# Altium project DC-UPS-v1.0.PrjPcb (part 6 of 8)

## Sheet Buck-Boost-Sheet.SchDoc
size A4; SheetNumber: 4; SheetTotal: 6
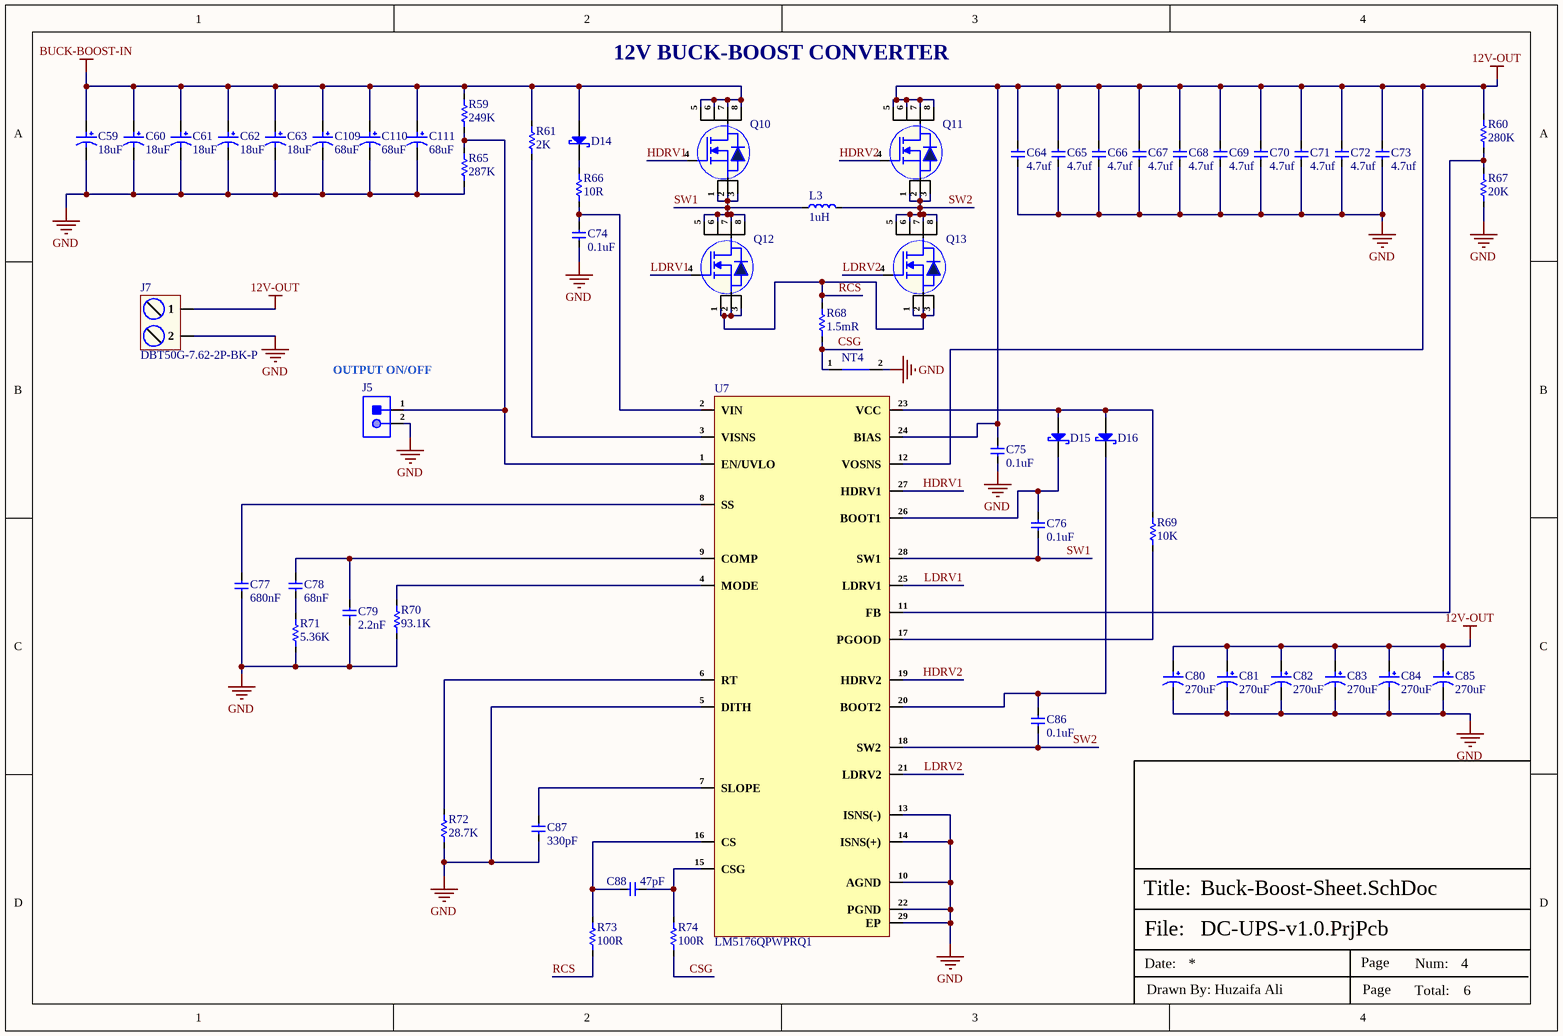
[diagram p3: Buck-Boost-Sheet.SchDoc]

### Parts
C59  18uF  [50SVPF18M]
C60  18uF  [50SVPF18M]
C61  18uF  [50SVPF18M]
C62  18uF  [50SVPF18M]
C63  18uF  [50SVPF18M]
C64  4.7uf  [Cap-0805]
C65  4.7uf  [Cap-0805]
C66  4.7uf  [Cap-0805]
C67  4.7uf  [Cap-0805]
C68  4.7uf  [Cap-0805]
C69  4.7uf  [Cap-0805]
C70  4.7uf  [Cap-0805]
C71  4.7uf  [Cap-0805]
C72  4.7uf  [Cap-0805]
C73  4.7uf  [Cap-0805]
C74  0.1uF  [CAP-0603]
C75  0.1uF  [CAP-0603]
C76  0.1uF  [CAP-0603]
C77  680nF  [Cap-1206]
C78  68nF  [Cap-0603]
C79  2.2nF  [Cap-0603]
C80  270uF  [16SVPG270M]
C81  270uF  [16SVPG270M]
C82  270uF  [16SVPG270M]
C83  270uF  [16SVPG270M]
C84  270uF  [16SVPG270M]
C85  270uF  [16SVPG270M]
C86  0.1uF  [CAP-0603]
C87  330pF  [Cap-0603]
C88  47pF  [Cap-0603]
C109  68uF  [50SVPF68M]
C110  68uF  [50SVPF68M]
C111  68uF  [50SVPF68M]
D14  CDBUR0230L-HF  [SOD-523F]  (value not drawn)
D15  CDBUR0230L-HF  [SOD-523F]  (value not drawn)
D16  B0520W  [SOD-123F]  (value not drawn)
J5  B2B-XH-A(LF)(SN)  [B2B-XH-A(LF)(SN)_]  (value not drawn)
J7  DBT50G-7.62-2P-BK-P  [DBT50G-7.62-2P-BK-P]
L3  1uH  [FXL2213-1R0-M]
NT4  Net Tie_SMD  [Net Tie Pad]  (value not drawn)  (net tie, no BOM)
Q10  CSD18511Q5A  [8-VSONP (5x6)]  (value not drawn)
Q11  CSD19533Q5A  [8-VSONP (5x6)]  (value not drawn)
Q12  CSD18531Q5A  [8-VSONP (5x6)]  (value not drawn)
Q13  CSD19533Q5A  [8-VSONP (5x6)]  (value not drawn)
R59  249K  [Res-0402]
R60  280K  [Res-0603]
R61  2K  [Res-0402]
R65  287K  [Res-0402]
R66  10R  [Res-0603]
R67  20K  [Res-0603]
R68  1.5mR  [5931]
R69  10K  [Res-0603]
R70  93.1K  [Res-0603]
R71  5.36K  [Res-0603]
R72  28.7K  [Res-0201]
R73  100R  [Res-0603]
R74  100R  [Res-0603]
U7  LM5176QPWPRQ1  [HTSSOP-28-EP]

### Nets
12V-OUT: C64.2 C65.2 C66.2 C67.2 C68.2 C69.2 C70.2 C71.2 C72.2 C73.2 C75.2 C80.1 C81.1 C82.1 C83.1 C84.1 C85.1 J7.1 Q11.5(D) Q11.6(D) Q11.7(D) Q11.8(D) R60.2 U7.12(VOSNS) U7.24(BIAS)
BUCK-BOOST-IN: C59.1 C60.1 C61.1 C62.1 C63.1 C109.1 C110.1 C111.1 D14.1(A) Q10.5(D) Q10.6(D) Q10.7(D) Q10.8(D) R59.2 R61.2
GND: C59.2 C60.2 C61.2 C62.2 C63.2 C64.1 C65.1 C66.1 C67.1 C68.1 C69.1 C70.1 C71.1 C72.1 C73.1 C74.1 C75.1 C77.1 C79.1 C80.2 C81.2 C82.2 C83.2 C84.2 C85.2 C87.1 C109.2 C110.2 C111.2 J5.2 J7.2 NT4.2 R65.1 R67.1 R70.1 R71.1 R72.1 U7.5(DITH) U7.10(AGND) U7.13(ISNS(-)) U7.14(ISNS(+)) U7.22(PGND) U7.29(EP)
CSG: NT4.1 R68.1 R74.1
HDRV1: Q10.4(G) U7.27(HDRV1)
HDRV2: Q11.4(G) U7.19(HDRV2)
LDRV1: Q12.4(G) U7.25(LDRV1)
LDRV2: Q13.4(G) U7.21(LDRV2)
RCS: Q12.1(S) Q12.2(S) Q12.3(S) Q13.1(S) Q13.2(S) Q13.3(S) R68.2 R73.1
SW1: C76.1 L3.1 Q10.1(S) Q10.2(S) Q10.3(S) Q12.5(D) Q12.6(D) Q12.7(D) Q12.8(D) U7.28(SW1)
SW2: C86.1 L3.2 Q11.1(S) Q11.2(S) Q11.3(S) Q13.5(D) Q13.6(D) Q13.7(D) Q13.8(D) U7.18(SW2)
NetC74_2: C74.2 R66.1 U7.2(VIN)
NetC76_2: C76.2 D15.2(K) U7.26(BOOT1)
NetC77_2: C77.2 U7.8(SS)
NetC78_1: C78.1 R71.2
NetC78_2: C78.2 C79.2 U7.9(COMP)
NetC86_2: C86.2 D16.1(K) U7.20(BOOT2)
NetC87_2: C87.2 U7.7(SLOPE)
NetC88_1: C88.1 R73.2 U7.16(CS)
NetC88_2: C88.2 R74.2 U7.15(CSG)
NetD14_2: D14.2(K) R66.2
NetD15_1: D15.1(A) D16.2(A) R69.2 U7.23(VCC)
NetJ5_1: J5.1 R59.1 R65.2 U7.1(EN/UVLO)
NetR60_1: R60.1 R67.2 U7.11(FB)
NetR61_1: R61.1 U7.3(VISNS)
NetR69_1: R69.1 U7.17(PGOOD)
NetR70_2: R70.2 U7.4(MODE)
NetR72_2: R72.2 U7.6(RT)

### Notes on the sheet
- 12V BUCK-BOOST CONVERTER
- (near J5) OUTPUT ON/OFF
- File:
- Title:
- Date:
- Page
- Num:
- Total:
- Drawn By: Huzaifa Ali

### Library data of the parts
C59-C63 = 50SVPF18M: CAP ALUM POLY 18UF 20% 50V SMD; Manufacturer: Panasonic; Item Type: Capacitors; Supplier: Mouser; LCSC Part Number: C178374; Manufacturer Part Number: 50SVPF18M; RoHS: Yes; Stock: 2258; Pricing: 1=1.44, 10=0.995, 50=0.995, 100=0.799, 1000=0.562, 10000=0.498 (USD); ComponentLink1URL: https://datasheet.ciiva.com/24033/svpf-os-262415-24033818.pdf?src-supplier=Mouser; ComponentLink1Description: https://datasheet.ciiva.com/24033/svpf-os-262415-24033818.pdf?src-supplier=Mouser; ComponentLink2URL: https://datasheet.ciiva.com/25761/1734360-25761272.pdf?src-supplier=Farnell; ComponentLink2Description: https://datasheet.ciiva.com/25761/1734360-25761272.pdf?src-supplier=Farnell; ComponentLink3URL: https://datasheet.ciiva.com/48542/svpf-eng-ds-48542431.pdf?src-supplier=Distrelec; ComponentLink3Description: https://datasheet.ciiva.com/48542/svpf-eng-ds-48542431.pdf?src-supplier=Distrelec; ComponentLink4URL: https://datasheet.ciiva.com/22746/1734360-22746277.pdf?src-supplier=Element14; ComponentLink4Description: https://datasheet.ciiva.com/22746/1734360-22746277.pdf?src-supplier=Element14
C64-C73 = GRM21BR61H475KE51L: CAP CER 4.7UF 50V X5R 0805; Manufacturer: Murata; Material: Ceramic; Tolerance: 10%; Item Type: Capacitor; Supplier 1: Rs; Manufacturer Part Number: GRM21BR61H475KE51L; RoHS: Yes; Category: Ceramic Capacitors; Stock 1: 37300; Pricing 1: 500=0.09400, 1000=0.08800, 2000=0.08300, 5000=0.07500 (GBP); Mount: Surface Mount; Case/Package: 0805; Case Code (Metric): 2012; Case Code (Imperial): 0805; Min Operating Temperature: -55°C; Max Operating Temperature: 85°C; Capacitance: 4.7uF; Packaging: Tape and Reel; Dielectric: X5R; Voltage Rating: 50V; Voltage Rating (DC): 50V; Series: GRM; Length: 2mm; Width: 0.049inch; Height: 1.25mm; Thickness: 0.055inch; Depth: 1.25mm; Reach SVHC Compliant: Yes; Lead Free: Lead Free; RoHS Compliant: Yes; ComponentLink1URL: http://www.farnell.com/datasheets/2079186.pdf?src-supplier=Farnell; ComponentLink1Description: http://www.farnell.com/datasheets/2079186.pdf?src-supplier=Farnell; ComponentLink2URL: http://components.arrow.com/part/dataview/61084395S454511N2606?src-supplier=Arrow+Electronics; ComponentLink2Description: http://components.arrow.com/part/dataview/61084395S454511N2606?src-supplier=Arrow+Electronics; ComponentLink3URL: http://www.farnell.com/datasheets/2079186.pdf?src-supplier=Element14; ComponentLink3Description: http://www.farnell.com/datasheets/2079186.pdf?src-supplier=Element14; ComponentLink4URL: http://search.murata.co.jp/Ceramy/image/img/A01X/G101/ENG/GRM21BR61H475KE51-01.pdf?src-supplier=Digi-Key; ComponentLink4Description: http://search.murata.co.jp/Ceramy/image/img/A01X/G101/ENG/GRM21BR61H475KE51-01.pdf?src-supplier=Digi-Key; ComponentLink5URL: https://search.murata.co.jp/Ceramy/image/img/A01X/G101/ENG/GRM21BR61H475KE51-01.pdf?src-supplier=Digi-Key; ComponentLink5Description: https://search.murata.co.jp/Ceramy/image/img/A01X/G101/ENG/GRM21BR61H475KE51-01.pdf?src-supplier=Digi-Key; ComponentLink6URL: http://www.farnell.com/datasheets/2079186.pdf?src-supplier=Newark; ComponentLink6Description: http://www.farnell.com/datasheets/2079186.pdf?src-supplier=Newark; Supplier Part Number 1: 1138707P; LCSC Part Number: C162420
C74-C76 C86 = CL10B104KB8NNNL: CAP CER 0.1UF 50V X7R 0603; Manufacturer: Samsung; Capacitance: 100nF; Tolerance: 10%; Item Type: Capacitor; Supplier 1: Digi-Key; Manufacturer Part Number: CL10B104KB8NNNL; Stock 1: 3731229; Pricing 1: 1=0.1, 10=0.03, 50=0.0164, 100=0.0134, 500=0.00958, 1000=0.00753, 2500=0.00684, 5000=0.0063 (USD); Mount: Surface Mount; Case/Package: 0603; Min Operating Temperature: -55°C; Max Operating Temperature: 125°C; Dielectric: X7R; Packaging: Tape and Reel; Package Quantity: 15000; Voltage Rating: 50V; Voltage Rating (DC): 50V; Series: CL; Construction: Flat; Length: 1.6mm; Width: 0.031inch; Height: 0.8mm; Thickness: 0.035inch; Depth: 0.8mm; Radiation Hardening: No; RoHS Compliant: Yes; ComponentLink1URL: https://www.verical.com/server-webapp/html/getDatasheet?partID=357523&src-supplier=Verical; ComponentLink1Description: https://www.verical.com/server-webapp/html/getDatasheet?partID=357523&src-supplier=Verical; ComponentLink2URL: https://media.digikey.com/pdf/Data%20Sheets/Samsung%20PDFs/CL_Series_MLCC_ds.pdf?src-supplier=Digi-Key; ComponentLink2Description: https://media.digikey.com/pdf/Data%20Sheets/Samsung%20PDFs/CL_Series_MLCC_ds.pdf?src-supplier=Digi-Key; Supplier Part Number 1: 1276-CL10B104KB8NNNLCT-ND; LCSC Part Number: C913912
C77 = ECP-U1C684MA5: CAP FILM 0.68UF 20% 16VDC 1206; Manufacturer: Panasonic; Item Type: Capacitors; Voltage Rating (AC): 16V; Supplier: Future Electronics; LCSC Part Number: C569898; Manufacturer Part Number: ECP-U1C684MA5; RoHS: Yes; Stock: 2000; Pricing: 2000=0.275, 4000=0.27, 6000=0.27, 8000=0.265 (USD); ComponentLink1URL: https://datasheet.ciiva.com/15225/getdatasheetpartid-259011-15225611.pdf?src-supplier=Verical; ComponentLink1Description: https://datasheet.ciiva.com/15225/getdatasheetpartid-259011-15225611.pdf?src-supplier=Verical; ComponentLink2URL: https://datasheet.ciiva.com/5710/31740-5710144.pdf?src-supplier=Farnell; ComponentLink2Description: https://datasheet.ciiva.com/5710/31740-5710144.pdf?src-supplier=Farnell; ComponentLink3URL: https://datasheet.ciiva.com/11792/0900766b80f2ea72-11792215.pdf?src-supplier=Rs; ComponentLink3Description: https://datasheet.ciiva.com/11792/0900766b80f2ea72-11792215.pdf?src-supplier=Rs; ComponentLink4URL: https://datasheet.ciiva.com/30243/abd0000ce12-30243739.pdf?src-supplier=Onlinecomponents.com; ComponentLink4Description: https://datasheet.ciiva.com/30243/abd0000ce12-30243739.pdf?src-supplier=Onlinecomponents.com; ComponentLink5URL: https://datasheet.ciiva.com/16397/abd0000ce12-16397064.pdf?src-supplier=Future+Electronics; ComponentLink5Description: https://datasheet.ciiva.com/16397/abd0000ce12-16397064.pdf?src-supplier=Future+Electronics; ComponentLink6URL: https://datasheet.ciiva.com/46399/31740-46399767.pdf?src-supplier=Element14; ComponentLink6Description: https://datasheet.ciiva.com/46399/31740-46399767.pdf?src-supplier=Element14; ComponentLink7URL: https://datasheet.ciiva.com/46400/31740-46400041.pdf?src-supplier=Element14; ComponentLink7Description: https://datasheet.ciiva.com/46400/31740-46400041.pdf?src-supplier=Element14; ComponentLink8URL: https://datasheet.ciiva.com/2993/abd0000ce12-2993739.pdf?src-supplier=Avnet; ComponentLink8Description: https://datasheet.ciiva.com/2993/abd0000ce12-2993739.pdf?src-supplier=Avnet
C78 = CC0603KRX7R9BB683: CAP CER 0.068UF 50V X7R 0603; Manufacturer: Yageo; Item Type: Capacitors; Material: 4241ConductorMaterial; Tolerance: 10%; Supplier: Future Electronics; Supplier Part Number: 3015344; Manufacturer Part Number: CC0603KRX7R9BB683; RoHS: Yes; Stock: 52000; Pricing: 4000=0.0058, 16000=0.0055, 60000=0.0052, 160000=0.005, 400000=0.0047 (USD); Mounting Technology: Surface Mount; Case/Package: 0603; Case Code (Imperial): 0603; Case Code (Metric): 1608; Weight: 7.1E-05oz; Min Operating Temperature: -55°C; Max Operating Temperature: 125°C; Value: 68nF; Voltage Rating (DC): 50V; Packaging: Tape and Reel; Voltage Rating: 50V; Dielectric: X7R; Termination: SMD/SMT; Series: CC; Length: 0.063inch; Width: 0.031inch; Thickness: 0.035inch; Lead Free: Lead Free; Halogen Free: Halogen Free; RoHS Compliant: Yes; ComponentLink1URL: http://www.mouser.com/ds/2/447/Yageo_UPY-GP_NP0_16V-to-50V_9-358835.pdf?src-supplier=Mouser; ComponentLink1Description: http://www.mouser.com/ds/2/447/Yageo_UPY-GP_NP0_16V-to-50V_9-358835.pdf?src-supplier=Mouser; ComponentLink2URL: https://datasheet.octopart.com/CC0603KRX7R9BB683-Yageo-datasheet-166511530.pdf?src-supplier=Future+Electronics; ComponentLink2Description: https://datasheet.octopart.com/CC0603KRX7R9BB683-Yageo-datasheet-166511530.pdf?src-supplier=Future+Electronics; ComponentLink3URL: http://www.yageo.com/documents/recent/UPY-GPHC_X7R_6.3V-to-50V_18.pdf?src-supplier=Digikey; ComponentLink3Description: http://www.yageo.com/documents/recent/UPY-GPHC_X7R_6.3V-to-50V_18.pdf?src-supplier=Digikey; ComponentLink4URL: https://www.yageo.com/upload/media/product/productsearch/datasheet/mlcc/UPY-GPHC_X7R_6.3V-to-50V_18.pdf?src-supplier=Digikey; ComponentLink4Description: https://www.yageo.com/upload/media/product/productsearch/datasheet/mlcc/UPY-GPHC_X7R_6.3V-to-50V_18.pdf?src-supplier=Digikey; ComponentLink5URL: https://datasheet.octopart.com/CC0603KRX7R9BB683-Yageo-datasheet-140260305.pdf?src-supplier=Newark; ComponentLink5Description: https://datasheet.octopart.com/CC0603KRX7R9BB683-Yageo-datasheet-140260305.pdf?src-supplier=Newark; ComponentLink6URL: http://www.yageo.com/documents/recent/UPY-GPHC_X7R_6.3V-to-50V_9.pdf?src-supplier=Future+Electronics; ComponentLink6Description: http://www.yageo.com/documents/recent/UPY-GPHC_X7R_6.3V-to-50V_9.pdf?src-supplier=Future+Electronics; LCSC Part Number: C107098
C79 = CC0603KRX7R9BB222: CAP CER 2200PF 50V X7R 0603; Manufacturer: Yageo; Tolerance: 10%; Insulation Resistance: 10GR; Dissipation Factor: 2.5%; Item Type: Capacitor; Supplier 1: RSComponents; Manufacturer Part Number: CC0603KRX7R9BB222; RoHS: Yes; Category: Ceramic Capacitors; Stock 1: 1; Pricing 1: 4000=0.00500 (USD); Mount: Surface Mount; Case/Package: 0603; Number of Pins: 2; Case Code (Metric): 1608; Case Code (Imperial): 0603; Min Operating Temperature: -55°C; Max Operating Temperature: 125°C; Capacitance: 2.2nF; Dielectric: X7R; Package Quantity: 1; Voltage Rating: 50V; Packaging: Tape and Reel; Voltage Rating (DC): 50V; Termination: SMD/SMT; Resistor Type: Ceramic; Voltage: 50V; Series: CC; Length: 1.6mm; Width: 0.031inch; Height: 0.8mm; Thickness: 0.035inch; Depth: 0.8mm; Radiation Hardening: No; REACH SVHC: No SVHC; Lead Free: Lead Free; Halogen Free: Halogen Free; RoHS Compliant: Yes; ComponentLink1URL: https://datasheet.ciiva.com/23768/1079489-23768004.pdf?src-supplier=Newark; ComponentLink1Description: https://datasheet.ciiva.com/23768/1079489-23768004.pdf?src-supplier=Newark; ComponentLink2URL: https://datasheet.ciiva.com/11788/0900766b8079c870-11788403.pdf?src-supplier=RSComponents; ComponentLink2Description: https://datasheet.ciiva.com/11788/0900766b8079c870-11788403.pdf?src-supplier=RSComponents; ComponentLink3URL: https://datasheet.ciiva.com/26862/getdatasheetpartid-403587-26862854.pdf?src-supplier=Verical; ComponentLink3Description: https://datasheet.ciiva.com/26862/getdatasheetpartid-403587-26862854.pdf?src-supplier=Verical; ComponentLink4URL: https://datasheet.ciiva.com/8033/70765-8033863.pdf?src-supplier=Element14; ComponentLink4Description: https://datasheet.ciiva.com/8033/70765-8033863.pdf?src-supplier=Element14; ComponentLink5URL: https://datasheet.ciiva.com/7978/1489800-7978172.pdf?src-supplier=Element14; ComponentLink5Description: https://datasheet.ciiva.com/7978/1489800-7978172.pdf?src-supplier=Element14; ComponentLink6URL: https://datasheet.ciiva.com/28450/1489800-28450632.pdf?src-supplier=Element14; ComponentLink6Description: https://datasheet.ciiva.com/28450/1489800-28450632.pdf?src-supplier=Element14; ComponentLink7URL: https://datasheet.ciiva.com/155/mlccorderingcode-155921.pdf?src-supplier=Digi-Key; ComponentLink7Description: https://datasheet.ciiva.com/155/mlccorderingcode-155921.pdf?src-supplier=Digi-Key; ComponentLink8URL: https://datasheet.ciiva.com/155/mlccorderingcode-155920.pdf?src-supplier=Digi-Key; ComponentLink8Description: https://datasheet.ciiva.com/155/mlccorderingcode-155920.pdf?src-supplier=Digi-Key; ComponentLink9URL: https://datasheet.ciiva.com/155/mlccorderingcode-155922.pdf?src-supplier=Digi-Key; ComponentLink9Description: https://datasheet.ciiva.com/155/mlccorderingcode-155922.pdf?src-supplier=Digi-Key; ComponentLink10URL: https://datasheet.ciiva.com/8033/1489800-8033864.pdf?src-supplier=Element14; ComponentLink10Description: https://datasheet.ciiva.com/8033/1489800-8033864.pdf?src-supplier=Element14; ComponentLink11URL: https://datasheet.ciiva.com/8033/1489800-8033862.pdf?src-supplier=Element14; ComponentLink11Description: https://datasheet.ciiva.com/8033/1489800-8033862.pdf?src-supplier=Element14; ComponentLink12URL: https://datasheet.ciiva.com/16625/upy-gphc-x7r-6-3v-to-50v-8-16625531.pdf?src-supplier=Avnet+Europe; ComponentLink12Description: https://datasheet.ciiva.com/16625/upy-gphc-x7r-6-3v-to-50v-8-16625531.pdf?src-supplier=Avnet+Europe; Supplier Part Number 1: 6169509; LCSC Part Number: C107082
C80-C85 = 16SVPG270M: CAP ALUM POLY 270UF 20% 16V SMD; Manufacturer: Panasonic; Item Type: Capacitors; Dielectric Material: Aluminium; Material: 4242ConductorMaterial; ESR (Equivalent Series Resistance): 8mR; Life (Hours): 5000Hour; Voltage: 24V; Leakage Current: 864uA; Dissipation Factor: 12%; Supplier: Arrow Electronics; LCSC Part Number: C178351; Manufacturer Part Number: 16SVPG270M; RoHS: Yes; Stock: 18500; Pricing: 500=0.5687, 1000=0.54, 2500=0.5149, 5000=0.5016, 10000=0.4827 (USD); Mounting Technology: Surface Mount; Case/Package: Radial; Pins: 10; Min Operating Temperature: -55°C; Max Operating Temperature: 105°C; Packaging: Tape and Reel; Voltage Rating: 16V; Tolerance: 20%; Value: 270uF; Series: SVPG; Package Quantity: 500; Termination: SMD/SMT; Voltage Rating (DC): 16V; Diameter: 6.3mm; Length: 9.9mm; Width: 6.6mm; Height: 6.6mm; Lead Pitch: 2.1mm; RoHS Compliant: Yes; Reach SVHC Compliant: No; Lead Free: Lead Free; ComponentLink1URL: http://www.farnell.com/datasheets/2579260.pdf?src-supplier=Farnell; ComponentLink1Description: http://www.farnell.com/datasheets/2579260.pdf?src-supplier=Farnell; ComponentLink2URL: http://industrial.panasonic.com/www-data/pdf/AAB8000/AAB8000CE14.pdf?src-supplier=Avnet; ComponentLink2Description: http://industrial.panasonic.com/www-data/pdf/AAB8000/AAB8000CE14.pdf?src-supplier=Avnet; ComponentLink3URL: http://industrial.panasonic.com/cdbs/www-data/pdf/AAB8000/AAB8000C175.pdf?src-supplier=Farnell; ComponentLink3Description: http://industrial.panasonic.com/cdbs/www-data/pdf/AAB8000/AAB8000C175.pdf?src-supplier=Farnell; ComponentLink4URL: http://www.farnell.com/datasheets/1950075.pdf?src-supplier=Element14; ComponentLink4Description: http://www.farnell.com/datasheets/1950075.pdf?src-supplier=Element14; ComponentLink5URL: https://datasheet.octopart.com/16SVPG270M-Panasonic-datasheet-138704366.pdf?src-supplier=TME; ComponentLink5Description: https://datasheet.octopart.com/16SVPG270M-Panasonic-datasheet-138704366.pdf?src-supplier=TME; ComponentLink6URL: https://datasheet.octopart.com/16SVPG270M-Panasonic-datasheet-151609408.pdf?src-supplier=Master+Electronics; ComponentLink6Description: https://datasheet.octopart.com/16SVPG270M-Panasonic-datasheet-151609408.pdf?src-supplier=Master+Electronics
C87 = CC0603JRNPO9BN331: CAP CER 330PF 50V C0G/NPO 0603; Manufacturer: Yageo; Dielectric Material: Ceramic; Multilayer: Yes; Tolerance  (fill in as +-): 5%; Temperature Characteristics Code: C0G; Item Type: Capacitor; Supplier 1: Future Electronics; Manufacturer Part Number: CC0603JRNPO9BN331; RoHS: Yes; Category: Ceramic Capacitors; Stock 1: 40000; Pricing 1: 4000=0.00990, 16000=0.00940, 20000=0.00980, 40000=0.00910, 80000=0.00930, 100000=0.00880, 160000=0.00830, 200000=0.00900, 500000=0.00850 (USD); Mounting Technology: Surface Mount; Pins: 2; Package Shape: Rectangular; Case/Package: 0603; Terminal Finish: Nickel; Min Operating Temperature: -55°C; Max Operating Temperature: 125°C; JESD-609 Code: e3; Value: 330pF; Capacitor Type: Ceramic; Package Style: SMTMeter; Packaging: Tape and Reel; Tolerance (fill in as +-): 5%; Rated DC Voltage (URdc): 50V; Termination: Wraparound; Length: 1.6mm; Width: 0.8mm; Height: 0.8mm; Reach SVHC Compliant: Yes; RoHS Compliant: Yes; ComponentLink1URL: https://datasheet.ciiva.com:443/pdfs/VipMasterIC/IC/YAGO/YAGO-S-A0009251638/YAGO-S-A0009251638-1.pdf?src-supplier=IHS+Markit; ComponentLink1Description: https://datasheet.ciiva.com:443/pdfs/VipMasterIC/IC/YAGO/YAGO-S-A0009251638/YAGO-S-A0009251638-1.pdf?src-supplier=IHS+Markit; ComponentLink2URL: https://datasheet.ciiva.com/28450/1443161-28450501.pdf?src-supplier=Element14; ComponentLink2Description: https://datasheet.ciiva.com/28450/1443161-28450501.pdf?src-supplier=Element14; ComponentLink3URL: https://datasheet.ciiva.com/144/mlccorderingcode-144957.pdf?src-supplier=Digi-Key; ComponentLink3Description: https://datasheet.ciiva.com/144/mlccorderingcode-144957.pdf?src-supplier=Digi-Key; ComponentLink4URL: https://datasheet.ciiva.com/144/mlccorderingcode-144956.pdf?src-supplier=Digi-Key; ComponentLink4Description: https://datasheet.ciiva.com/144/mlccorderingcode-144956.pdf?src-supplier=Digi-Key; ComponentLink5URL: https://datasheet.ciiva.com/144/mlccorderingcode-144958.pdf?src-supplier=Digi-Key; ComponentLink5Description: https://datasheet.ciiva.com/144/mlccorderingcode-144958.pdf?src-supplier=Digi-Key; ComponentLink6URL: https://datasheet.ciiva.com/8033/1443161-8033739.pdf?src-supplier=Element14; ComponentLink6Description: https://datasheet.ciiva.com/8033/1443161-8033739.pdf?src-supplier=Element14; ComponentLink7URL: https://datasheet.ciiva.com/8033/1443161-8033737.pdf?src-supplier=Element14; ComponentLink7Description: https://datasheet.ciiva.com/8033/1443161-8033737.pdf?src-supplier=Element14; ComponentLink8URL: https://datasheet.ciiva.com/13389/upy-gp-np0-16v-to-50v-8-13389983.pdf?src-supplier=Mouser; ComponentLink8Description: https://datasheet.ciiva.com/13389/upy-gp-np0-16v-to-50v-8-13389983.pdf?src-supplier=Mouser; ComponentLink9URL: https://datasheet.ciiva.com/11587/upy-gp-np0-16v-to-50v-8-11587326.pdf?src-supplier=Avnet; ComponentLink9Description: https://datasheet.ciiva.com/11587/upy-gp-np0-16v-to-50v-8-11587326.pdf?src-supplier=Avnet; ComponentLink10URL: https://datasheet.ciiva.com/26829/getdatasheetpartid-403533-26829382.pdf?src-supplier=Verical; ComponentLink10Description: https://datasheet.ciiva.com/26829/getdatasheetpartid-403533-26829382.pdf?src-supplier=Verical; Supplier Part Number 1: 8843708; LCSC Part Number: C62784
C88 = CC0603FRNPO9BN470: CAP CER 47PF 50V NPO 0603; Manufacturer: Yageo; Item Type: Capacitor; Supplier: Digikey; LCSC Part Number: C519486; Manufacturer Part Number: CC0603FRNPO9BN470; RoHS: Yes; Stock: 37282; Pricing: 1=0.19, 10=0.126, 50=0.0756, 100=0.0594, 500=0.0439, 1000=0.03634 (USD); ComponentLink1URL: https://datasheet.ciiva.com/5425/upy-gp-np0-16v-to-50v-8-5425545.pdf?src-supplier=Mouser; ComponentLink1Description: https://datasheet.ciiva.com/5425/upy-gp-np0-16v-to-50v-8-5425545.pdf?src-supplier=Mouser; ComponentLink2URL: https://datasheet.ciiva.com/11586/upy-gp-np0-16v-to-50v-8-11586472.pdf?src-supplier=Avnet; ComponentLink2Description: https://datasheet.ciiva.com/11586/upy-gp-np0-16v-to-50v-8-11586472.pdf?src-supplier=Avnet
C109-C111 = 50SVPF68M: CAP ALUM POLY 68UF 20% 50V SMD; Manufacturer: Panasonic; Item Type: Capacitors; Material: 4242ConductorMaterial; Supplier: Future Electronics; LCSC Part Number: C178375; Manufacturer Part Number: 50SVPF68M; RoHS: Yes; Stock: 8800; Pricing: 400=1.08, 800=1.05, 1200=1.03, 1600=1.02, 2000=0.985 (USD); ComponentLink1URL: https://datasheet.ciiva.com/25761/1734360-25761295.pdf?src-supplier=Farnell; ComponentLink1Description: https://datasheet.ciiva.com/25761/1734360-25761295.pdf?src-supplier=Farnell; ComponentLink2URL: https://datasheet.ciiva.com/24071/svpf-os-262415-24071528.pdf?src-supplier=Mouser; ComponentLink2Description: https://datasheet.ciiva.com/24071/svpf-os-262415-24071528.pdf?src-supplier=Mouser; ComponentLink3URL: https://datasheet.ciiva.com/22746/1734360-22746280.pdf?src-supplier=Element14; ComponentLink3Description: https://datasheet.ciiva.com/22746/1734360-22746280.pdf?src-supplier=Element14
D14 D15 = CDBUR0230L-HF: 35V Independent Type 500mV@200mA 200mA SOD-523F Schottky Diodes ROHS; Manufacturer: Comchip; Item Type: Diode; Supplier: Mouser; LCSC Part Number: C3012739; Manufacturer Part Number: CDBUR0230L-HF; RoHS: Yes; Stock: 3840; Pricing: 1=0.38, 10=0.263, 50=0.263, 100=0.133, 1000=0.081, 10000=0.055 (USD); RoHS Compliant: Yes; ComponentLink1URL: http://www.mouser.com/ds/2/80/CDBUR0230L-RevB718340-56369.pdf?src-supplier=Mouser; ComponentLink1Description: http://www.mouser.com/ds/2/80/CDBUR0230L-RevB718340-56369.pdf?src-supplier=Mouser
D16 = B0520W: 20V 385mV@0.5A 500mA SOD-123 Schottky Diodes ROHS; Manufacturer: SINEDEVICE; Item Type: Diode; Manufacturer Part Number: B0520W; Package: SOD-123; LCSC Part Number: C22439176; ComponentLink1Description: LCSC; ComponentLink1URL: https://www.lcsc.com/product-detail/Schottky-Diodes_SINEDEVICE-B0520W_C22439176.html
J5 = B2B-XH-A(LF)(SN): Conn Shrouded Header (4 Sides) HDR 2 POS 2.5mm Solder ST Thru-Hole Box; Manufacturer: JST; Number of Positions: 2; Connector Type: Male Pin; Current Rating: 3A; Contact Resistance: 20mR; Voltage Rating: 250V; Insulation Resistance: 1GR; Wire/Cable Gauge: 22AWG; Item Type: JST Connector; Supplier 1: Farnell; Manufacturer Part Number: B2B-XH-A(LF)(SN); RoHS: Yes; Category: FFC / FPC; Stock 1: 219240; Pricing 1: 100=0.06860, 1000=0.04800, 2500=0.04520, 5000=0.04230, 10000=0.03950, 20000=0.03660 (GBP); Mount: Through Hole; Contact Plating: Tin,Copper,Lead; Color: Natural; Contact Material: Brass; Housing Color: White; Housing Material: Polyamide; Min Operating Temperature: -25°C; Max Operating Temperature: 85°C; Number of Rows: 1; Packaging: Bulk; Termination: Solder; Fastening Type: Detent; Max Current Rating: 3A; Voltage Rating (AC): 250V; Max Voltage Rating (AC): 250V; Number of Contacts: 2; Max Voltage Rating (DC): 250V; Orientation: Straight; Length: 7.4mm; Pitch: 2.5mm; Lead Pitch: 2.5mm; Depth: 5.75mm; REACH SVHC: No SVHC; Lead Free: Lead Free; ComponentLink1URL: https://datasheet.ciiva.com/26894/getdatasheetpartid-640357-26894434.pdf?src-supplier=Verical; ComponentLink1Description: https://datasheet.ciiva.com/26894/getdatasheetpartid-640357-26894434.pdf?src-supplier=Verical; ComponentLink2URL: https://datasheet.ciiva.com/11746/0900766b8082653e-11746979.pdf?src-supplier=RSComponents; ComponentLink2Description: https://datasheet.ciiva.com/11746/0900766b8082653e-11746979.pdf?src-supplier=RSComponents; ComponentLink3URL: https://datasheet.ciiva.com/26894/getdatasheetpartid-385291-26894760.pdf?src-supplier=Verical; ComponentLink3Description: https://datasheet.ciiva.com/26894/getdatasheetpartid-385291-26894760.pdf?src-supplier=Verical; ComponentLink4URL: https://datasheet.ciiva.com/8052/5448-8052024.pdf?src-supplier=Element14; ComponentLink4Description: https://datasheet.ciiva.com/8052/5448-8052024.pdf?src-supplier=Element14; ComponentLink5URL: https://datasheet.ciiva.com/20207/523653-20207167.pdf?src-supplier=Rapid+Electronics; ComponentLink5Description: https://datasheet.ciiva.com/20207/523653-20207167.pdf?src-supplier=Rapid+Electronics; Supplier Part Number 1: 1516276; LCSC Part Number: C158012
J7 = DBT50G-7.62-2P-BK-P: 1x2P Corner With Cover Plate 2 1 7.62mm -40℃~+105℃ 20A 300V Black 12~22 Straight Needle Plugin,P=7.62mm Barrier Terminal Blocks ROHS; Manufacturer: DORABO; Manufacturer Part Number: DBT50G-7.62-2P-BK-P; Package: Plugin,P=7.62mm; LCSC Part Number: C496127; Item Type: Terminal Block; ComponentLink1Description: LCSC; ComponentLink1URL: https://www.lcsc.com/product-detail/Barrier-Terminal-Blocks_DORABO-DBT50G-7-62-2P-BK-P_C496127.html
L3 = FXL2213-1R0-M: 60A 1uH ±20% 60A SMD,23.5x22mm Power Inductors ROHS; Manufacturer: cjiang; Manufacturer Part Number: FXL2213-1R0-M; Package: SMD,23.5x22mm; LCSC Part Number: C22378751; Item Type: Inductors; ComponentLink1Description: LCSC; ComponentLink1URL: https://www.lcsc.com/product-detail/Power-Inductors_cjiang-Changjiang-Microelectronics-Tech-FXL2213-1R0-M_C22378751.html
NT4 = Net Tie_SMD: Net Tie SMD; Manufacturer Part Number: Net Tie; Item Type: Net Tie Pad
Q10 = CSD18511Q5A: MOSFET N-CH 40V 159A 8VSON; Manufacturer: Texas Instruments; Item Type: IC; Supplier: Mouser; LCSC Part Number: C701747; Manufacturer Part Number: CSD18511Q5A; RoHS: Yes; Stock: 1551; Pricing: 1=1.08, 10=0.885, 50=0.885, 100=0.688, 1000=0.475, 10000=0.416 (USD); ComponentLink1URL: http://www.ti.com/general/docs/suppproductinfo.tsp?distId=10&amp;gotoUrl=http%3A%2F%2Fwww.ti.com%2Flit%2Fgpn%2Fcsd18511q5a&src-supplier=Digikey; ComponentLink1Description: http://www.ti.com/general/docs/suppproductinfo.tsp?distId=10&amp;gotoUrl=http%3A%2F%2Fwww.ti.com%2Flit%2Fgpn%2Fcsd18511q5a&src-supplier=Digikey; ComponentLink2URL: http://www.ti.com/lit/ds/symlink/csd18511q5a.pdf?src-supplier=Digikey; ComponentLink2Description: http://www.ti.com/lit/ds/symlink/csd18511q5a.pdf?src-supplier=Digikey
Q11 Q13 = CSD19533Q5A: MOSFET N-CH 100V 100A 8VSON; Manufacturer: Texas Instruments; Item Type: MOSFETs; Rds On Max: 9.4mR; Input Capacitance: 2.67nF; Rise Time: 6ns; Max Power Dissipation: 3.2W; Threshold Voltage: 2.8V; Number of Elements: 1; Turn-Off Delay Time: 16ns; Fall Time: 5ns; Gate to Source Voltage (Vgs): 20V; Element Configuration: Single; Drain to Source Resistance: 8.7mR; Polarity: N-CHANNEL; Supplier: Mouser; LCSC Part Number: C110197; Manufacturer Part Number: CSD19533Q5A; RoHS: Yes; Stock: 14779; Pricing: 1=1.43, 10=1.17, 50=1.17, 100=0.907, 1000=0.626, 10000=0.535 (USD); Mounting Technology: Surface Mount; Case/Package: SON; Pins: 8; Contact Plating: Tin; Min Operating Temperature: -55°C; Max Operating Temperature: 150°C; Package Quantity: 2500; Packaging: Tape and Reel; Drain to Source Voltage (Vdss): 100V; Continuous Drain Current (ID): 100A; Power Dissipation: 3.2W; Turn-On Delay Time: 6ns; Number of Channels: 1; Series: NexFET™; Drain to Source Breakdown Voltage: 100V; Lead Free: Contains Lead; Reach SVHC Compliant: No; RoHS Compliant: Yes; ComponentLink1URL: https://datasheet.ciiva.com/29752/csd19533q5a-29752194.pdf?src-supplier=Digikey; ComponentLink1Description: https://datasheet.ciiva.com/29752/csd19533q5a-29752194.pdf?src-supplier=Digikey; ComponentLink2URL: https://datasheet.ciiva.com/46430/1824682-46430379.pdf?src-supplier=Element14; ComponentLink2Description: https://datasheet.ciiva.com/46430/1824682-46430379.pdf?src-supplier=Element14; ComponentLink3URL: https://datasheet.ciiva.com/29752/csd19533q5a-29752206.pdf?src-supplier=Digikey; ComponentLink3Description: https://datasheet.ciiva.com/29752/csd19533q5a-29752206.pdf?src-supplier=Digikey; ComponentLink4URL: https://datasheet.ciiva.com/30021/csd19533q5a-30021948.pdf?src-supplier=Avnet; ComponentLink4Description: https://datasheet.ciiva.com/30021/csd19533q5a-30021948.pdf?src-supplier=Avnet
Q12 = CSD18531Q5A: MOSFET N-CH 60V 19A/100A 8VSON; Manufacturer: Texas Instruments; Item Type: MOSFETs; Number of Channels: 1NUMBER; Supplier: Mouser; LCSC Part Number: C2683366; Manufacturer Part Number: CSD18531Q5A; RoHS: Yes; Stock: 2842; Pricing: 1=1.48, 10=1.22, 50=1.22, 100=0.944, 1000=0.652, 10000=0.558 (USD); Thickness: 1mm; ComponentLink1URL: https://datasheet.ciiva.com/6386/csd18531q5a-6386406.pdf?src-supplier=Digikey; ComponentLink1Description: https://datasheet.ciiva.com/6386/csd18531q5a-6386406.pdf?src-supplier=Digikey; ComponentLink2URL: https://datasheet.ciiva.com/13063/csd18531q5a-108247-13063440.pdf?src-supplier=Mouser; ComponentLink2Description: https://datasheet.ciiva.com/13063/csd18531q5a-108247-13063440.pdf?src-supplier=Mouser; ComponentLink3URL: https://datasheet.ciiva.com/23868/1762944-23868000.pdf?src-supplier=Newark; ComponentLink3Description: https://datasheet.ciiva.com/23868/1762944-23868000.pdf?src-supplier=Newark; ComponentLink4URL: https://datasheet.ciiva.com/14192/slps321b-14192915.pdf?src-supplier=Avnet; ComponentLink4Description: https://datasheet.ciiva.com/14192/slps321b-14192915.pdf?src-supplier=Avnet; ComponentLink5URL: https://datasheet.ciiva.com/22712/1733500-22712609.pdf?src-supplier=Element14; ComponentLink5Description: https://datasheet.ciiva.com/22712/1733500-22712609.pdf?src-supplier=Element14; ComponentLink6URL: https://datasheet.ciiva.com/6386/csd18531q5a-6386407.pdf?src-supplier=Digikey; ComponentLink6Description: https://datasheet.ciiva.com/6386/csd18531q5a-6386407.pdf?src-supplier=Digikey; ComponentLink7URL: https://datasheet.ciiva.com/6386/csd18531q5a-6386408.pdf?src-supplier=Digikey; ComponentLink7Description: https://datasheet.ciiva.com/6386/csd18531q5a-6386408.pdf?src-supplier=Digikey
R59 = 0402WGF2493TCE: 62.5mW Thick Film Resistors 50V ±100ppm/℃ ±1% 249kΩ 0402 Chip Resistor - Surface Mount ROHS; Manufacturer: Royal Electronic Factory; Supplier: Mouser; Supplier Part Number: 303-0402WGF2493TCE; Manufacturer Part Number: 0402WGF2493TCE; RoHS: No; Pricing: 10000=0.004 (USD); LCSC Part Number: C11425; Item Type: Resistor
R60 = RT0603BRD07280KL: RES SMD 280K OHM 0.1% 1/10W 0603; Manufacturer: Yageo; Item Type: Resistors; Voltage Rating: 75V; Value: 280kR; Power Rating: 100mW; Temperature Coefficient: 25ppm/°C; Voltage Rating (DC): 50V; Supplier: Avnet; LCSC Part Number: C705755; Manufacturer Part Number: RT0603BRD07280KL; RoHS: Yes; Stock: 4250; Pricing: 1=0.322, 25=0.153, 50=0.111 (USD); Case/Package: 0603; Case Code (Metric): 1608; Case Code (Imperial): 0603; Min Operating Temperature: -55°C; Max Operating Temperature: 155°C; Tolerance: 0.1%; Packaging: Tape and Reel; Termination: SMD/SMT; Number of Terminations: 2; Max Power Dissipation: 100mW; Features: Moisture Resistant; Series: RT; Length: 0.063inch; Width: 0.031inch; Height: 0.022inch; Lead Free: Lead Free; RoHS Compliant: Yes; ComponentLink1URL: https://datasheet.ciiva.com/12725/pyu-rt-1-to-0-05-rohs-l-4-12725605.pdf?src-supplier=Mouser; ComponentLink1Description: https://datasheet.ciiva.com/12725/pyu-rt-1-to-0-05-rohs-l-4-12725605.pdf?src-supplier=Mouser
R61 = RC0402FR-072KL: RES 2K OHM 1% 1/16W 0402; Manufacturer: Yageo; Item Type: Resistor; Value: 2kR; Power Rating: 63mW; Voltage Rating: 50V; Temperature Coefficient: 100ppm/°C; LCSC Part Number: C60488; ComponentLink2URL: https://datasheet.ciiva.com/11808/0900766b80c66297-11808787.pdf?src-supplier=Rs; ComponentLink2Description: https://datasheet.ciiva.com/11808/0900766b80c66297-11808787.pdf?src-supplier=Rs; ComponentLink3URL: https://datasheet.ciiva.com/7849/1018594-7849934.pdf?src-supplier=Element14; ComponentLink3Description: https://datasheet.ciiva.com/7849/1018594-7849934.pdf?src-supplier=Element14; ComponentLink4URL: https://datasheet.ciiva.com/7849/1018594-7849935.pdf?src-supplier=Element14; ComponentLink4Description: https://datasheet.ciiva.com/7849/1018594-7849935.pdf?src-supplier=Element14; ComponentLink5URL: https://datasheet.ciiva.com/7983/1018594-7983517.pdf?src-supplier=Element14; ComponentLink5Description: https://datasheet.ciiva.com/7983/1018594-7983517.pdf?src-supplier=Element14; ComponentLink6URL: https://datasheet.ciiva.com/2453/pyu-r-int-thick-7-2453635.pdf?src-supplier=Digi-Key; ComponentLink6Description: https://datasheet.ciiva.com/2453/pyu-r-int-thick-7-2453635.pdf?src-supplier=Digi-Key; ComponentLink7URL: https://datasheet.ciiva.com/2453/pyu-r-int-thick-7-2453636.pdf?src-supplier=Digi-Key; ComponentLink7Description: https://datasheet.ciiva.com/2453/pyu-r-int-thick-7-2453636.pdf?src-supplier=Digi-Key; ComponentLink8URL: https://datasheet.ciiva.com/2453/pyu-r-int-thick-7-2453634.pdf?src-supplier=Digi-Key; ComponentLink8Description: https://datasheet.ciiva.com/2453/pyu-r-int-thick-7-2453634.pdf?src-supplier=Digi-Key; ComponentLink9URL: https://datasheet.ciiva.com/12667/pyu-rc0402-51-rohs-l-6-r-12667451.pdf?src-supplier=Mouser; ComponentLink9Description: https://datasheet.ciiva.com/12667/pyu-rc0402-51-rohs-l-6-r-12667451.pdf?src-supplier=Mouser; ComponentLink10URL: https://datasheet.ciiva.com/15189/getdatasheetpartid-358921-15189414.pdf?src-supplier=Verical; ComponentLink10Description: https://datasheet.ciiva.com/15189/getdatasheetpartid-358921-15189414.pdf?src-supplier=Verical; Supplier: Future Electronics; Supplier Part Number: 7970452; Manufacturer Part Number: RC0402FR-072KL; RoHS: Yes; Category: Chip SMD Resistors; Stock: 8530000; Pricing: 10000=0.0018, 100000=0.0011, 200000=0.0017, 300000=0.001, 750000=0.0016, 2000000=0.0009, 2500000=0.0016, 10000000=0.0014 (USD); Case/Package: 0402; Case Code (Metric): 1005; Case Code (Imperial): 0402; Min Operating Temperature: -55°C; Max Operating Temperature: 155°C; Resistor Type: Thick Film; Tolerance: 1%; Package Quantity: 1; Packaging: Tape and Reel; Number of Terminations: 2; Termination: SMD/SMT; Max Power Dissipation: 63mW; Working Voltage: 50V; Features: Moisture Resistant; Series: RC; Technology: THICK FILM; Construction: Rectangular; Resistance Tolerance: 1%; Voltage Rating (DC): 50V; Length: 0.039inch; Width: 0.02inch; Height: 0.016inch; Depth: 0.5mm; RoHS Compliant: Yes; Military Standard: Not; Reach SVHC Compliant: Unknown; Lead Free: 5697LeadFree; ComponentLink1URL: https://datasheet.ciiva.com/11808/0900766b80c66297-11808787.pdf?src-supplier=Rs; ComponentLink1Description: https://datasheet.ciiva.com/11808/0900766b80c66297-11808787.pdf?src-supplier=Rs; ComponentLink11URL: https://datasheet.ciiva.com/2453/pyu-r-int-thick-7-2453635.pdf?src-supplier=Digikey; ComponentLink11Description: https://datasheet.ciiva.com/2453/pyu-r-int-thick-7-2453635.pdf?src-supplier=Digikey; ComponentLink12URL: https://datasheet.ciiva.com/2453/pyu-r-int-thick-7-2453636.pdf?src-supplier=Digikey; ComponentLink12Description: https://datasheet.ciiva.com/2453/pyu-r-int-thick-7-2453636.pdf?src-supplier=Digikey; ComponentLink13URL: https://datasheet.ciiva.com/2453/pyu-r-int-thick-7-2453634.pdf?src-supplier=Digikey; ComponentLink13Description: https://datasheet.ciiva.com/2453/pyu-r-int-thick-7-2453634.pdf?src-supplier=Digikey
R65 = RC0402FR-07287KL: RES 287K OHM 1% 1/16W 0402; Manufacturer: Yageo; Item Type: Resistors; Supplier: Avnet; LCSC Part Number: C327358; Manufacturer Part Number: RC0402FR-07287KL; RoHS: Yes; Stock: 10000; Pricing: 1=0.104, 25=0.009, 100=0.005 (USD); Lead Free: 5697LeadFree; ComponentLink1URL: http://www.mouser.com/ds/2/447/PYu-RC0402_51_RoHS_L_6_r-8721.pdf?src-supplier=Mouser; ComponentLink1Description: http://www.mouser.com/ds/2/447/PYu-RC0402_51_RoHS_L_6_r-8721.pdf?src-supplier=Mouser; ComponentLink2URL: http://www.yageo.com/documents/recent/PYu-RC0402_51_RoHS_L_6.pdf?src-supplier=Avnet; ComponentLink2Description: http://www.yageo.com/documents/recent/PYu-RC0402_51_RoHS_L_6.pdf?src-supplier=Avnet; ComponentLink3URL: https://datasheet.octopart.com/RC0402FR-07287KL-Yageo-datasheet-164759695.pdf?src-supplier=Future+Electronics; ComponentLink3Description: https://datasheet.octopart.com/RC0402FR-07287KL-Yageo-datasheet-164759695.pdf?src-supplier=Future+Electronics; ComponentLink4URL: http://www.yageo.com/documents/recent/PYu-RC_Group_51_RoHS_L_9.pdf?src-supplier=Digikey; ComponentLink4Description: http://www.yageo.com/documents/recent/PYu-RC_Group_51_RoHS_L_9.pdf?src-supplier=Digikey; ComponentLink5URL: http://www.yageo.com.tw/exep/pages/download/literatures/PYu-R_INT-thick_7.pdf?src-supplier=Digikey; ComponentLink5Description: http://www.yageo.com.tw/exep/pages/download/literatures/PYu-R_INT-thick_7.pdf?src-supplier=Digikey
R66 = RC0603FR-0710RL: RES SMD 10 OHM 1% 1/10W 0603; Manufacturer: Yageo; Temperature Coefficient: 200ppm/°C; Power Rating: 100mW; Voltage Rating: 50V; Item type: Resistor; Supplier 1: Digi-Key; Manufacturer Part Number: RC0603FR-0710RL; Stock 1: 10836596; Pricing 1: 1=0.1, 10=0.046, 100=0.0187, 1000=0.0084, 2500=0.00729 (USD); Case/Package: 0603; Number of Pins: 2; Case Code (Imperial): 0603; Case Code (Metric): 1608; Contact Plating: Tin,Matte; Min Operating Temperature: -55°C; Max Operating Temperature: 155°C; Resistance: 10R; Tolerance: 1%; Composition: Thick Film; Packaging: Tape and Reel; Voltage Rating (DC): 50V; Termination: SMD/SMT; Military Standard: Not; Length: 1.6mm; Height: 0.45mm; Width: 0.8mm; Depth: 0.8mm; Radiation Hardening: No; Lead Free: Lead Free; REACH SVHC: No SVHC; ComponentLink1URL: http://www.farnell.com/datasheets/1868787.pdf?src-supplier=Element14; ComponentLink1Description: http://www.farnell.com/datasheets/1868787.pdf?src-supplier=Element14; ComponentLink2URL: http://www.yageo.com/documents/recent/PYu-RC0603_51_RoHS_L_4.pdf?src-supplier=Avnet; ComponentLink2Description: http://www.yageo.com/documents/recent/PYu-RC0603_51_RoHS_L_4.pdf?src-supplier=Avnet; ComponentLink3URL: http://documents.rs-components.com/techlib://itc_doclist_GB.htm?stockno=5048984&src-supplier=RSComponents; ComponentLink3Description: http://documents.rs-components.com/techlib://itc_doclist_GB.htm?stockno=5048984&src-supplier=RSComponents; ComponentLink4URL: http://www.yageo.com/documents/recent/PYu-RC0603_51_RoHS_L_4.pdf?src-supplier=Avnet+Europe; ComponentLink4Description: http://www.yageo.com/documents/recent/PYu-RC0603_51_RoHS_L_4.pdf?src-supplier=Avnet+Europe; Supplier Part Number 1: 311-10.0HRDKR-ND; LCSC Part Number: C109318
R67 = RT0603BRD0720KL: RES SMD 20K OHM 0.1% 1/10W 0603; Manufacturer: Yageo; Power Rating: 100mW; Temperature Coefficient: 25ppm/°C; Resistance: 20kR; Voltage Rating: 75V; Voltage Rating (DC): 50V; Item Type: Resistor; Supplier 1: Arrow Electronics; Manufacturer Part Number: RT0603BRD0720KL; RoHS: Yes; Category: Chip SMD Resistors; Stock 1: 190000; Pricing 1: 5000=0.04300, 10000=0.03130, 25000=0.02970, 50000=0.02940, 125000=0.02040 (USD); Case/Package: 0603; Case Code (Imperial): 0603; Case Code (Metric): 1608; Weight: 7.1E-05oz; Contact Plating: Tin,Lead; Size Code: 0603; Min Operating Temperature: -55°C; Max Operating Temperature: 125°C; Tolerance: 0.1%; Packaging: Tape and Reel; Package Quantity: 5000; Resistor Type: Thin Film; Termination: SMD/SMT; Number of Terminations: 2; Max Power Dissipation: 100mW; Features: Moisture Resistant; Series: RT; Construction: Rectangular; Length: 1.6mm; Width: 0.8mm; Height: 0.022inch; Depth: 0.8mm; RoHS Compliant: Yes; Military Standard: Not; Lead Free: Lead Free; ComponentLink1URL: https://datasheet.ciiva.com/2585/pyu-rt-1-to-0-05-rohs-l-4-2585771.pdf?src-supplier=Digi-Key; ComponentLink1Description: https://datasheet.ciiva.com/2585/pyu-rt-1-to-0-05-rohs-l-4-2585771.pdf?src-supplier=Digi-Key; ComponentLink2URL: https://datasheet.ciiva.com/46634/pyu-rt-1-to-0-05-rohs-l-5-46634970.pdf?src-supplier=Digi-Key; ComponentLink2Description: https://datasheet.ciiva.com/46634/pyu-rt-1-to-0-05-rohs-l-5-46634970.pdf?src-supplier=Digi-Key; Supplier Part Number 1: RT0603BRD0720KL; LCSC Part Number: C723637
R68 = WSLP59311L500FEB: RES 0.0015 OHM 1% 10W 5931; Manufacturer: Vishay Dale; Item Type: Resistors; Max Power Dissipation: 7W; Temperature Coefficient: 75ppm/°C; Supplier: Digikey; LCSC Part Number: C4057265; Manufacturer Part Number: WSLP59311L500FEB; RoHS: Yes; Pricing: 1000=1.15544 (USD); Case/Package: 5931; Min Operating Temperature: -65°C; Max Operating Temperature: 170°C; Package Quantity: 1000; Packaging: Tape and Reel; Value: 1.5mR; Number of Terminations: 2; Tolerance: 1%; Features: Moisture Resistant; Series: WSLP; Length: 0.591inch; Width: 0.305inch; Height: 0.02inch; ComponentLink1URL: http://www.vishay.com/docs/30176/wslp3921.pdf?src-supplier=Digikey; ComponentLink1Description: http://www.vishay.com/docs/30176/wslp3921.pdf?src-supplier=Digikey
R69 = RC0603FR-0710KL: RES SMD 10K Ohm 1% 1/10W 0603; Manufacturer: Yageo; Resistance: 10kR; Temperature Coefficient: 100ppm/°C; Voltage Rating (DC): 50V; Power Rating: 100mW; Voltage Rating: 75V; Item Type: Resistor; Supplier 1: Digi-Key; Manufacturer Part Number: RC0603FR-0710KL; RoHS: Yes; Category: Chip SMD Resistors; Stock 1: 25249139; Pricing 1: 1=0.10000, 10=0.02400, 100=0.00970, 1000=0.00436, 2500=0.00378 (USD); Case/Package: 0603; Number of Pins: 2; Case Code (Imperial): 0603; Case Code (Metric): 1608; Weight: 7.1E-05oz; Size Code: 0603; Min Operating Temperature: -55°C; Max Operating Temperature: 155°C; Tolerance: 1%; Resistor Type: Thick Film; Packaging: Tape and Reel; Termination: SMD/SMT; Features: Moisture Resistant; Series: RC; Max Power Dissipation: 100mW; Number of Terminations: 2; Resistance Tolerance: 1%; Construction: Rectangular; Length: 1.6mm; Width: 0.8mm; Height: 0.45mm; Depth: 0.8mm; Lead Pitch: 0.3mm; REACH SVHC: Unknown; Lead Free: Lead Free; Military Standard: Not; RoHS Compliant: Yes; ComponentLink1URL: https://datasheet.ciiva.com/7660/38590-7660789.pdf?src-supplier=Element14; ComponentLink1Description: https://datasheet.ciiva.com/7660/38590-7660789.pdf?src-supplier=Element14; ComponentLink2URL: https://datasheet.ciiva.com/7983/443971-7983596.pdf?src-supplier=Element14; ComponentLink2Description: https://datasheet.ciiva.com/7983/443971-7983596.pdf?src-supplier=Element14; ComponentLink3URL: https://datasheet.ciiva.com/22747/443971-22747519.pdf?src-supplier=Element14; ComponentLink3Description: https://datasheet.ciiva.com/22747/443971-22747519.pdf?src-supplier=Element14; ComponentLink4URL: https://datasheet.ciiva.com/46440/1868787-46440891.pdf?src-supplier=Element14; ComponentLink4Description: https://datasheet.ciiva.com/46440/1868787-46440891.pdf?src-supplier=Element14; ComponentLink5URL: https://datasheet.ciiva.com/7746/1738695-7746239.pdf?src-supplier=Element14; ComponentLink5Description: https://datasheet.ciiva.com/7746/1738695-7746239.pdf?src-supplier=Element14; ComponentLink6URL: https://datasheet.ciiva.com/15189/getdatasheetpartid-409289-15189591.pdf?src-supplier=Verical; ComponentLink6Description: https://datasheet.ciiva.com/15189/getdatasheetpartid-409289-15189591.pdf?src-supplier=Verical; Supplier Part Number 1: 311-10.0KHRCT-ND; LCSC Part Number: C98220
R70 = RC0603FR-0793K1L: RES 93.1K OHM 1% 1/10W 0603; Manufacturer: Yageo; Item Type: Resistors; Voltage Rating (DC): 50V; Supplier: Future Electronics; LCSC Part Number: C273780; Manufacturer Part Number: RC0603FR-0793K1L; RoHS: Yes; Stock: 20000; Pricing: 5000=0.0015, 50000=0.0014, 150000=0.0013, 375000=0.0013, 1000000=0.0012 (USD); Lead Free: 5697LeadFree; ComponentLink1URL: https://datasheet.ciiva.com/2455/pyu-r-int-thick-7-2455338.pdf?src-supplier=Digikey; ComponentLink1Description: https://datasheet.ciiva.com/2455/pyu-r-int-thick-7-2455338.pdf?src-supplier=Digikey; ComponentLink2URL: https://datasheet.ciiva.com/2455/pyu-r-int-thick-7-2455339.pdf?src-supplier=Digikey; ComponentLink2Description: https://datasheet.ciiva.com/2455/pyu-r-int-thick-7-2455339.pdf?src-supplier=Digikey; ComponentLink3URL: https://datasheet.ciiva.com/2455/pyu-r-int-thick-7-2455340.pdf?src-supplier=Digikey; ComponentLink3Description: https://datasheet.ciiva.com/2455/pyu-r-int-thick-7-2455340.pdf?src-supplier=Digikey
R71 = CRCW06035K36FKEA: RES SMD 5.36K OHM 1% 1/10W 0603; Manufacturer: Vishay; Item Type: Resistor; Voltage Rating (DC): 75V; Supplier: Mouser; LCSC Part Number: C2076915; Manufacturer Part Number: CRCW06035K36FKEA; RoHS: Yes; Stock: 195980; Pricing: 1=0.1, 10=0.017, 50=0.017, 100=0.01, 1000=0.008, 10000=0.004 (USD); Pins: 2NUMBER; Lead Free: 5697LeadFree; ComponentLink1URL: https://datasheet.ciiva.com/3257/dcrcwe3-3257765.pdf?src-supplier=Avnet; ComponentLink1Description: https://datasheet.ciiva.com/3257/dcrcwe3-3257765.pdf?src-supplier=Avnet; ComponentLink2URL: https://datasheet.ciiva.com/5541/dcrcwe3-109170-5541375.pdf?src-supplier=Mouser; ComponentLink2Description: https://datasheet.ciiva.com/5541/dcrcwe3-109170-5541375.pdf?src-supplier=Mouser; ComponentLink3URL: https://datasheet.ciiva.com/16789/70201119-16789112.pdf?src-supplier=Allied+Electronics; ComponentLink3Description: https://datasheet.ciiva.com/16789/70201119-16789112.pdf?src-supplier=Allied+Electronics; ComponentLink4URL: https://datasheet.ciiva.com/7792/125364-7792346.pdf?src-supplier=Element14; ComponentLink4Description: https://datasheet.ciiva.com/7792/125364-7792346.pdf?src-supplier=Element14; ComponentLink5URL: https://datasheet.ciiva.com/7679/1697337-7679125.pdf?src-supplier=Element14; ComponentLink5Description: https://datasheet.ciiva.com/7679/1697337-7679125.pdf?src-supplier=Element14; ComponentLink6URL: https://datasheet.ciiva.com/7679/1697337-7679126.pdf?src-supplier=Element14; ComponentLink6Description: https://datasheet.ciiva.com/7679/1697337-7679126.pdf?src-supplier=Element14; ComponentLink7URL: https://datasheet.ciiva.com/22707/1697337-22707754.pdf?src-supplier=Element14; ComponentLink7Description: https://datasheet.ciiva.com/22707/1697337-22707754.pdf?src-supplier=Element14
R72 = RC0201FR-0728K7L: RES 28.7K OHM 1% 1/20W 0201; Manufacturer: Yageo; Item Type: Resistors; Voltage Rating: 25V; Supplier: Avnet; LCSC Part Number: C138158; Manufacturer Part Number: RC0201FR-0728K7L; RoHS: Yes; Stock: 10000; Pricing: 1=0.104, 25=0.015, 100=0.008, 250=0.007, 500=0.006 (USD); ComponentLink1URL: https://www.yageo.com/upload/media/product/productsearch/datasheet/rchip/PYu-RC_Group_51_RoHS_L_11.pdf?src-supplier=Digikey; ComponentLink1Description: https://www.yageo.com/upload/media/product/productsearch/datasheet/rchip/PYu-RC_Group_51_RoHS_L_11.pdf?src-supplier=Digikey; ComponentLink2URL: http://www.yageo.com/documents/recent/PYu-RC_Group_51_RoHS_L_10.pdf?src-supplier=Digikey; ComponentLink2Description: http://www.yageo.com/documents/recent/PYu-RC_Group_51_RoHS_L_10.pdf?src-supplier=Digikey; ComponentLink3URL: http://www.yageo.com/documents/recent/PYu-RC_Group_51_RoHS_L_9.pdf?src-supplier=Digikey; ComponentLink3Description: http://www.yageo.com/documents/recent/PYu-RC_Group_51_RoHS_L_9.pdf?src-supplier=Digikey; ComponentLink4URL: https://datasheet.octopart.com/RC0201FR-0728K7L-Yageo-datasheet-164759695.pdf?src-supplier=Future+Electronics; ComponentLink4Description: https://datasheet.octopart.com/RC0201FR-0728K7L-Yageo-datasheet-164759695.pdf?src-supplier=Future+Electronics
R73 R74 = RC0603FR-07100RL: RES SMD 100 OHM 1% 1/10W 0603; Manufacturer: Yageo; Temperature Coefficient: 100ppm/°C; Voltage Rating (DC): 50V; Power Rating: 100mW; Item Type: Resistor; Supplier 1: Arrow Electronics; Manufacturer Part Number: RC0603FR-07100RL; RoHS: Yes; Category: Chip SMD Resistors; Stock 1: 3800000; Pricing 1: 5000=0.00300, 5000=0.00200, 5000=0.00450, 50000=0.00410, 500000=0.00230, 2500000=0.00140 (USD); Case/Package: 0603; Number of Pins: 2; Case Code (Imperial): 0603; Case Code (Metric): 1608; Size Code: 0603; Min Operating Temperature: -55°C; Max Operating Temperature: 155°C; Resistance: 100R; Tolerance: 1%; Resistor Type: Thick Film; Packaging: Tape and Reel; Voltage Rating: 50V; Termination: SMD/SMT; Features: Moisture Resistant; Series: RC; Max Power Dissipation: 100mW; Number of Terminations: 2; Construction: Rectangular; Resistance Tolerance: 1%; Technology: THICK FILM; Length: 1.6mm; Width: 0.8mm; Height: 0.45mm; Depth: 0.8mm; REACH SVHC: Unknown; Lead Free: Lead Free; RoHS Compliant: Yes; Military Standard: Not; Supplier Part Number 1: RC0603FR-07100RL; LCSC Part Number: C105588
U7 = LM5176QPWPRQ1: IC POWER REGULATOR; Manufacturer: Texas Instruments; Supplier: Mouser; LCSC Part Number: C2860809; Manufacturer Part Number: LM5176QPWPRQ1; RoHS: Yes; Item Type: IC; Stock: 7665; Pricing: 1=5.61, 10=5.37, 50=5.24, 100=4.96, 1000=4.47, 10000=4.4 (USD)